# Altium project LM358 PRO.PrjPcb
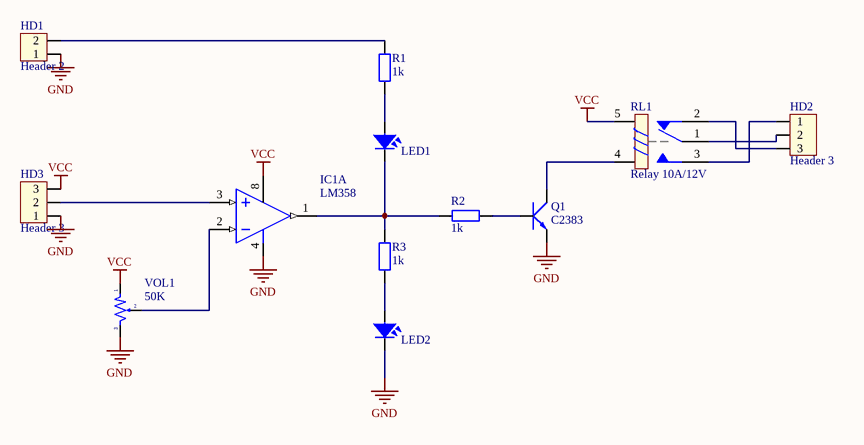
[diagram p0: Sheet1.SchDoc]
1 sheet, 12 parts. Net scope: global (net labels, ports and power ports of the same name join across sheets).
Board file: PCB1.PcbDoc

## Sheet Sheet1.SchDoc
size A; SheetNumber: 1; SheetTotal: 1

### Parts
HD1  Header 2  [HED2]
HD2  Header 3  [HED3]
HD3  Header 3  [HED3]
IC1  LM358  [DIP8/W0.3]  (part A of 2)
LED1  LED  [LED-5-RED]  (value not drawn)
LED2  LED  [LED-5-Green]  (value not drawn)
Q1  C2383  [QTO-92]
R1  1k  [R1/4W]
R2  1k  [R1/4W]
R3  1k  [R1/4W]
RL1  Relay 10A/12V  [RL_SPDT_10A]
VOL1  50K  [VOL_SMD]

### Nets
GND: HD1.1 HD3.1 IC1.4(-V) LED2.2 Q1.1(E) VOL1.3
VCC: HD3.3 IC1.8(+V) RL1.5 VOL1.1
NetHD1_2: HD1.2 R1.2
NetHD2_1: HD2.1 RL1.3
NetHD2_2: HD2.2 RL1.1
NetHD2_3: HD2.3 RL1.2
NetHD3_2: HD3.2 IC1.3(IN+)
NetIC1_1: IC1.1(OUT) LED1.2 R2.1 R3.2
NetIC1_2: IC1.2(IN-) VOL1.2
NetLED1_1: LED1.1 R1.1
NetLED2_1: LED2.1 R3.1
NetQ1_2: Q1.2(C) RL1.4
NetQ1_3: Q1.3(B) R2.2

### Library data of the parts
HD1 = Hed2: Header 2 (Green); Value: Header 2
HD2 HD3 = Hed3: Header 3 (Green); Value: Header 3
IC1 = LM358: Low-Power Dual Operational Amplifier; Value: LM358
LED1 LED2 = LED: LED Single colour Green and Red; Value: LED 3 ly Single Colour
Q1 = NPN_ECB: P 600mW, ECB; Value: C1815
R1-R3 = R1/4W: Resistor 1/4W; Value: R1/4W - 1K
RL1 = Relay 1: Relay SPDT,10A - 12VDC 5 Pin; Value: Relay SPDT, 10A, 12V
VOL1 = VOL-S: Var Resistor; Value: Volume 50k